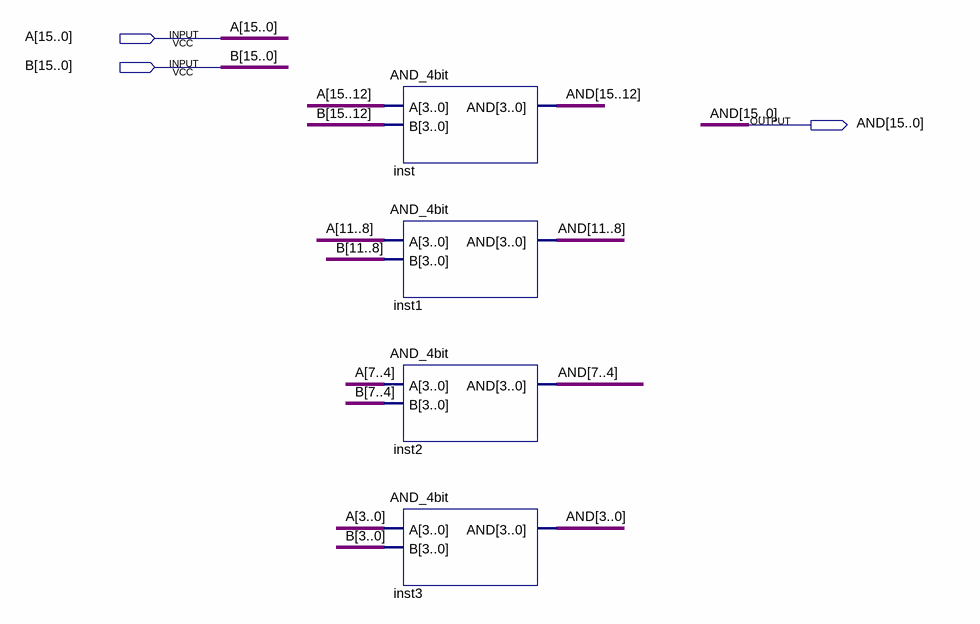
[diagram p0: schematic sheet]
// Quartus schematic AND_16bit.bdf as structural Verilog: 4 symbols, 3 pins
module AND_16bit (
  input  [15:0] A,
  input  [15:0] B,
  output [15:0] AND
);

  AND_4bit inst (.A(A[15:12]), .B(B[15:12]), .AND(AND[15:12]));
  AND_4bit inst1 (.A(A[11:8]), .B(B[11:8]), .AND(AND[11:8]));
  AND_4bit inst2 (.A(A[7:4]), .B(B[7:4]), .AND(AND[7:4]));
  AND_4bit inst3 (.A(A[3:0]), .B(B[3:0]), .AND(AND[3:0]));
endmodule
